# Altium schematic sheet Power Supply.SchDoc
size A4; DocumentNumber: 2; SheetNumber: 2; SheetTotal: 6
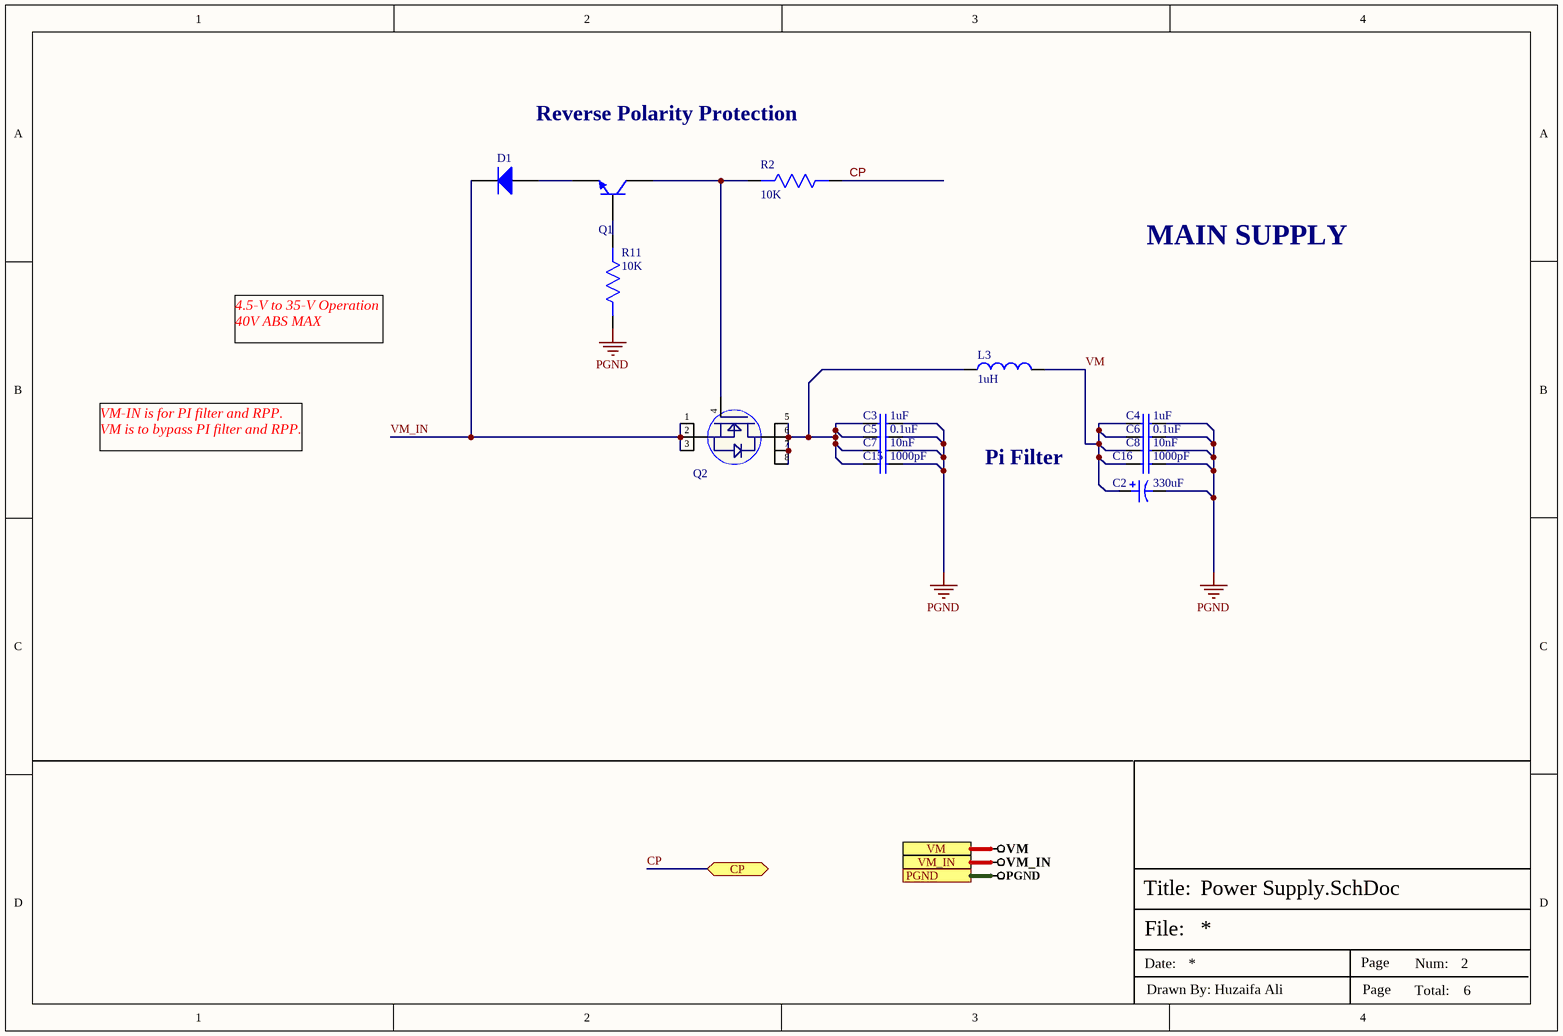
[diagram p0: Power Supply.SchDoc]

## Parts
C2  330uF  [VZT-330uF-10mmDia]
C3  1uF  [Cap-1206]
C4  1uF  [Cap-1206]
C5  0.1uF  [Cap-0603]
C6  0.1uF  [Cap-0603]
C7  10nF  [Cap-0603]
C8  10nF  [Cap-0603]
C15  1000pF  [Cap-0402]
C16  1000pF  [Cap-0402]
D1  S1A-13-F  [SMA]  (value not drawn)
L3  1uH  [WPN4020H1R0MT_]
Q1  LH8050QLT1G  [SOT-23-3L_]  (value not drawn)
Q2  NCE6008AS  [SOP-8]  (value not drawn)
R2  10K  [Res-0603]
R11  10K  [Res-0603]

## Ports
CP (bidir), PGND, VM, VM_IN

## Nets
PGND: C2.2 C3.1 C4.1 C5.1 C6.1 C7.2 C8.2 C15.1 C16.1 R11.2 ; port PGND
VM: C2.1 C4.2 C6.2 C8.1 C16.2 L3.2 ; port VM
VM_IN: D1.1 Q2.1(S) Q2.2(S) Q2.3(S) ; port VM_IN
CP: R2.1 ; port CP
NetC3_2: C3.2 C5.2 C7.1 C15.2 L3.1 Q2.5(D) Q2.6(D) Q2.7(D) Q2.8(D)
NetD1_2: D1.2 Q1.2(E)
NetQ1_1: Q1.1(B) R11.1
NetQ1_3: Q1.3(C) Q2.4(G) R2.2

## Notes on the sheet
- Reverse Polarity Protection
- MAIN SUPPLY
- 4.5-V to 35-V Operation
  40V ABS MAX
- VM-IN is for PI filter and RPP.
  VM is to bypass PI filter and RPP.
- Pi Filter
- File:
- Title:
- Date:
- Page
- Num:
- Total:
- Drawn By: Huzaifa Ali

## Library data of the parts
C2 = VZT331M1HTR-1010: VZT Series 50 V 330 uF 105°C 10 x 10 mm SMT Aluminum Electrolytic Capacitor; Manufacturer: Surge Components; Manufacturer Part Number: VZT331M1HTR-1010S; Supplier 1: Future Electronics; RoHS: Yes; Stock 1: 35000; Pricing 1: 500=0.28000, 1500=0.27000, 2000=0.26500, 5000=0.26000, 7500=0.25000 (USD); Lead Free: Lead Free; Supplier Part Number 1: 8161943
C3 C4 = GRM31CR72A105KA01K: CAP CER 1UF 100V X7R 1206; Manufacturer: Murata; Tolerance: 10%; Supplier 1: Digi-Key; Manufacturer Part Number: GRM31CR72A105KA01K; RoHS: Yes; Category: Ceramic Capacitors; Stock 1: 11842; Pricing 1: 1=0.48000, 10=0.33000, 50=0.23100, 100=0.19800, 500=0.14850, 1000=0.12540, 2500=0.11880 (USD); Mount: Surface Mount; Case/Package: 1206; Case Code (Imperial): 1206; Case Code (Metric): 3216; Min Operating Temperature: -55°C; Max Operating Temperature: 125°C; Capacitance: 1uF; Voltage Rating: 100V; Voltage Rating (DC): 100V; Packaging: Tape and Reel; Package Quantity: 1; Dielectric: X7R; Termination: SMD/SMT; Series: GRM; Construction: Flat; Length: 3.2mm; Width: 1.6mm; Height: 1.6mm; Thickness: 0.071inch; Depth: 1.6mm; Radiation Hardening: No; RoHS Compliant: Yes; ComponentLink1URL: https://datasheet.ciiva.com/11616/product-11616604.pdf?src-supplier=Avnet; ComponentLink1Description: https://datasheet.ciiva.com/11616/product-11616604.pdf?src-supplier=Avnet; ComponentLink2URL: https://datasheet.ciiva.com/6264/partnumbering-e-01-6264397.pdf?src-supplier=Digi-Key; ComponentLink2Description: https://datasheet.ciiva.com/6264/partnumbering-e-01-6264397.pdf?src-supplier=Digi-Key; ComponentLink3URL: https://datasheet.ciiva.com/6264/partnumbering-e-01-6264398.pdf?src-supplier=Digi-Key; ComponentLink3Description: https://datasheet.ciiva.com/6264/partnumbering-e-01-6264398.pdf?src-supplier=Digi-Key; ComponentLink4URL: https://datasheet.ciiva.com/6264/partnumbering-e-01-6264399.pdf?src-supplier=Digi-Key; ComponentLink4Description: https://datasheet.ciiva.com/6264/partnumbering-e-01-6264399.pdf?src-supplier=Digi-Key; Supplier Part Number 1: 490-6523-1-ND; LCSC Part Number: C909823
C5 C6 = CC0603KRX7R0BB104: CAP CER 0.1UF 100V X7R 0603; Manufacturer: Yageo; Capacitance: 100nF; Tolerance: 10%; Supplier 1: Digi-Key; Manufacturer Part Number: CC0603KRX7R0BB104; RoHS: Yes; Category: Ceramic Capacitors; Stock 1: 60476; Pricing 1: 1=0.19000, 10=0.13500, 50=0.07680, 100=0.06370, 500=0.04466, 1000=0.03696 (USD); Mount: Surface Mount; Case/Package: 0603; Case Code (Metric): 1608; Case Code (Imperial): 0603; Weight: 7.1E-05oz; Min Operating Temperature: -55°C; Max Operating Temperature: 125°C; Package Quantity: 4000; Voltage Rating: 100V; Packaging: Tape and Reel; Dielectric: X7R; Termination: SMD/SMT; Resistor Type: Ceramic; Voltage Rating (DC): 100V; Series: CC; Length: 0.063inch; Width: 0.031inch; Thickness: 0.035inch; Depth: 0.8mm; Lead Free: Lead Free; RoHS Compliant: Yes; ComponentLink1URL: https://datasheet.ciiva.com/6277/mlccorderingcode-6277030.pdf?src-supplier=Digi-Key; ComponentLink1Description: https://datasheet.ciiva.com/6277/mlccorderingcode-6277030.pdf?src-supplier=Digi-Key; ComponentLink2URL: https://datasheet.ciiva.com/6277/mlccorderingcode-6277081.pdf?src-supplier=Digi-Key; ComponentLink2Description: https://datasheet.ciiva.com/6277/mlccorderingcode-6277081.pdf?src-supplier=Digi-Key; ComponentLink3URL: https://datasheet.ciiva.com/6277/mlccorderingcode-6277082.pdf?src-supplier=Digi-Key; ComponentLink3Description: https://datasheet.ciiva.com/6277/mlccorderingcode-6277082.pdf?src-supplier=Digi-Key; Supplier Part Number 1: 311-1523-1-ND; LCSC Part Number: C113803
C7 C8 = AC0603KRX7R0BB103: 100V 10nF X7R ±10% 0603 Multilayer Ceramic Capacitors MLCC - SMD/SMT ROHS
C15 C16 = 885012205080: CAP CER 1000PF 100V X7R 0402; Manufacturer: Wurth Electronics; Supplier 1: Digi-Key; Manufacturer Part Number: 885012205080; RoHS: Yes; Stock 1: 13604; Pricing 1: 1=0.10000, 10=0.01900, 100=0.01730, 500=0.01532 (USD); ComponentLink1URL: https://katalog.we-online.de/pbs/datasheet/885012205080.pdf?src-supplier=Digi-Key; ComponentLink1Description: https://katalog.we-online.de/pbs/datasheet/885012205080.pdf?src-supplier=Digi-Key; Supplier Part Number 1: 732-12243-1-ND; LCSC Part Number: C2176546
D1 = S1A-13-F: Diode Switching 50V 1A 2-Pin SMA T/R; Manufacturer: Diodes; Element Configuration: Single; Reverse Recovery Time: 3us; Peak Non-Repetitive Surge Current: 30A; Max Reverse Current: 5uA; Forward Voltage: 1.1V; Recovery Time: 1.8us; Polarity: Standard; Capacitance: 10pF; ComponentLink1URL: http://www.mouser.com/ds/2/115/ds16008-60440.pdf?src-supplier=Mouser; ComponentLink1Description: http://www.mouser.com/ds/2/115/ds16008-60440.pdf?src-supplier=Mouser; ComponentLink2URL: http://www.diodes.com///datasheets/ds16008.pdf?src-supplier=Avnet; ComponentLink2Description: http://www.diodes.com///datasheets/ds16008.pdf?src-supplier=Avnet; ComponentLink3URL: http://www.te.com/commerce/DocumentDelivery/DDEController?Action=showdoc&DocId=Data+Sheet%7FRPII%2F2%7F0415%7Fpdf%7FEnglish%7FENG_DS_RPIIX2_0415.pdf&src-supplier=Digi-Key; ComponentLink3Description: http://www.te.com/commerce/DocumentDelivery/DDEController?Action=showdoc&DocId=Data+Sheet%7FRPII%2F2%7F0415%7Fpdf%7FEnglish%7FENG_DS_RPIIX2_0415.pdf&src-supplier=Digi-Key; ComponentLink4URL: https://www.diodes.com/assets/Datasheets/ds16008.pdf?src-supplier=Digi-Key; ComponentLink4Description: https://www.diodes.com/assets/Datasheets/ds16008.pdf?src-supplier=Digi-Key; Supplier 1: Digi-Key; Manufacturer Part Number: S1A-13-F; RoHS: Yes; Category: Rectifier Diodes; Stock 1: 647079; Pricing 1: 1=0.26000, 10=0.21300, 100=0.11290, 500=0.07424, 1000=0.05049, 2000=0.04554 (USD); Mount: Surface Mount; Case/Package: SMA; Number of Pins: 2; Weight: 0.002258oz; Min Operating Temperature: -65°C; Max Operating Temperature: 150°C; Forward Current: 1A; Max Repetitive Reverse Voltage (Vrrm): 50V; Packaging: Tape and Reel; Package Quantity: 5000; Max Surge Current: 30A; Reverse Voltage (DC): 50V; Average Rectified Current: 1A; Voltage Rating (DC): 50V; Current Rating: 1A; Output Current: 1A; Max Reverse Voltage (DC): 50V; Max Forward Surge Current (Ifsm): 30A; Termination: SMD/SMT; Series: -; Length: 4.6mm; Width: 2.92mm; Height: 2.1mm; Radiation Hardening: No; Lead Free: Lead Free; REACH SVHC: No SVHC; RoHS Compliant: Yes; ComponentLink5URL: https://datasheet.ciiva.com/911/ds16003-911872.pdf?src-supplier=Digi-Key; ComponentLink5Description: https://datasheet.ciiva.com/911/ds16003-911872.pdf?src-supplier=Digi-Key; ComponentLink6URL: https://datasheet.ciiva.com/27052/1541520-27052419.pdf?src-supplier=Jameco; ComponentLink6Description: https://datasheet.ciiva.com/27052/1541520-27052419.pdf?src-supplier=Jameco; ComponentLink7URL: https://datasheet.ciiva.com/22695/1911706-22695830.pdf?src-supplier=Element14; ComponentLink7Description: https://datasheet.ciiva.com/22695/1911706-22695830.pdf?src-supplier=Element14; ComponentLink8URL: https://datasheet.ciiva.com/16199/ds16003-16199336.pdf?src-supplier=Future+Electronics; ComponentLink8Description: https://datasheet.ciiva.com/16199/ds16003-16199336.pdf?src-supplier=Future+Electronics; ComponentLink9URL: https://datasheet.ciiva.com/4453/ds16003-83672-4453580.pdf?src-supplier=Mouser; ComponentLink9Description: https://datasheet.ciiva.com/4453/ds16003-83672-4453580.pdf?src-supplier=Mouser; ComponentLink10URL: https://datasheet.ciiva.com/25953/ds16003-25953033.pdf?src-supplier=Avnet+Europe; ComponentLink10Description: https://datasheet.ciiva.com/25953/ds16003-25953033.pdf?src-supplier=Avnet+Europe; ComponentLink11URL: https://datasheet.ciiva.com/8301/ds16003-8301429.pdf?src-supplier=Avnet; ComponentLink11Description: https://datasheet.ciiva.com/8301/ds16003-8301429.pdf?src-supplier=Avnet; Supplier Part Number 1: S1A-FDICT-ND; LCSC Part Number: C150735
L3 = WPN4020H1R0MT: FIXED IND 1UH 5.8A 26 MOHM SMD; Manufacturer: Sunlord; Supplier 1: Digi-Key; Manufacturer Part Number: WPN4020H1R0MT; RoHS: Yes; Category: Fixed Inductors; Supplier Part Number 1: 3442-WPN4020H1R0MTTR-ND; LCSC Part Number: C98359
Q1 = LH8050QLT1G: 100nA 50V 225mW 1.5A 500mV@800mA,80mA NPN -55℃~+150℃@(Tj) SOT-23(SOT-23-3) Bipolar Transistors - BJT ROHS
Q2 = NCE6008AS: 60V 8A 2.1W 20mΩ@10V,8A 2.2V@250uA N Channel SOP-8 MOSFETs ROHS
R2 R11 = AC0603JR-0710KL: RES SMD 10K OHM 5% 1/10W 0603; Manufacturer: Yageo; Voltage Rating: 50V; Resistance: 10kR; Power Rating: 100mW; Temperature Coefficient: 100ppm/°C; Supplier 1: Future Electronics; Manufacturer Part Number: AC0603JR-0710KL; RoHS: Yes; Category: Chip SMD Resistors; Stock 1: 1533000; Pricing 1: 5000=0.00540 (USD); Case/Package: 0603; Case Code (Imperial): 0603; Case Code (Metric): 1608; Size Code: 0603; Min Operating Temperature: -55°C; Max Operating Temperature: 155°C; Packaging: Tape and Reel; Tolerance: 5%; Package Quantity: 1; Resistor Type: Thick Film; Termination: SMD/SMT; Number of Terminations: 2; Max Power Dissipation: 100mW; Features: Moisture Resistant,Automotive AEC-Q200,Anti-Sulfur; Series: AC; Construction: Rectangular; Length: 0.063inch; Width: 0.031inch; Height: 0.022inch; Depth: 0.8mm; Military Standard: Not; Lead Free: Lead Free; RoHS Compliant: Yes; ComponentLink1URL: https://datasheet.ciiva.com/5562/pyu-ac-51-rohs-l-2-5562553.pdf?src-supplier=Mouser; ComponentLink1Description: https://datasheet.ciiva.com/5562/pyu-ac-51-rohs-l-2-5562553.pdf?src-supplier=Mouser; Supplier Part Number 1: 1029044; LCSC Part Number: C140867